# Altium schematic sheet Haberlesme.SchDoc
size A4; SheetNumber: 5; SheetTotal: 6
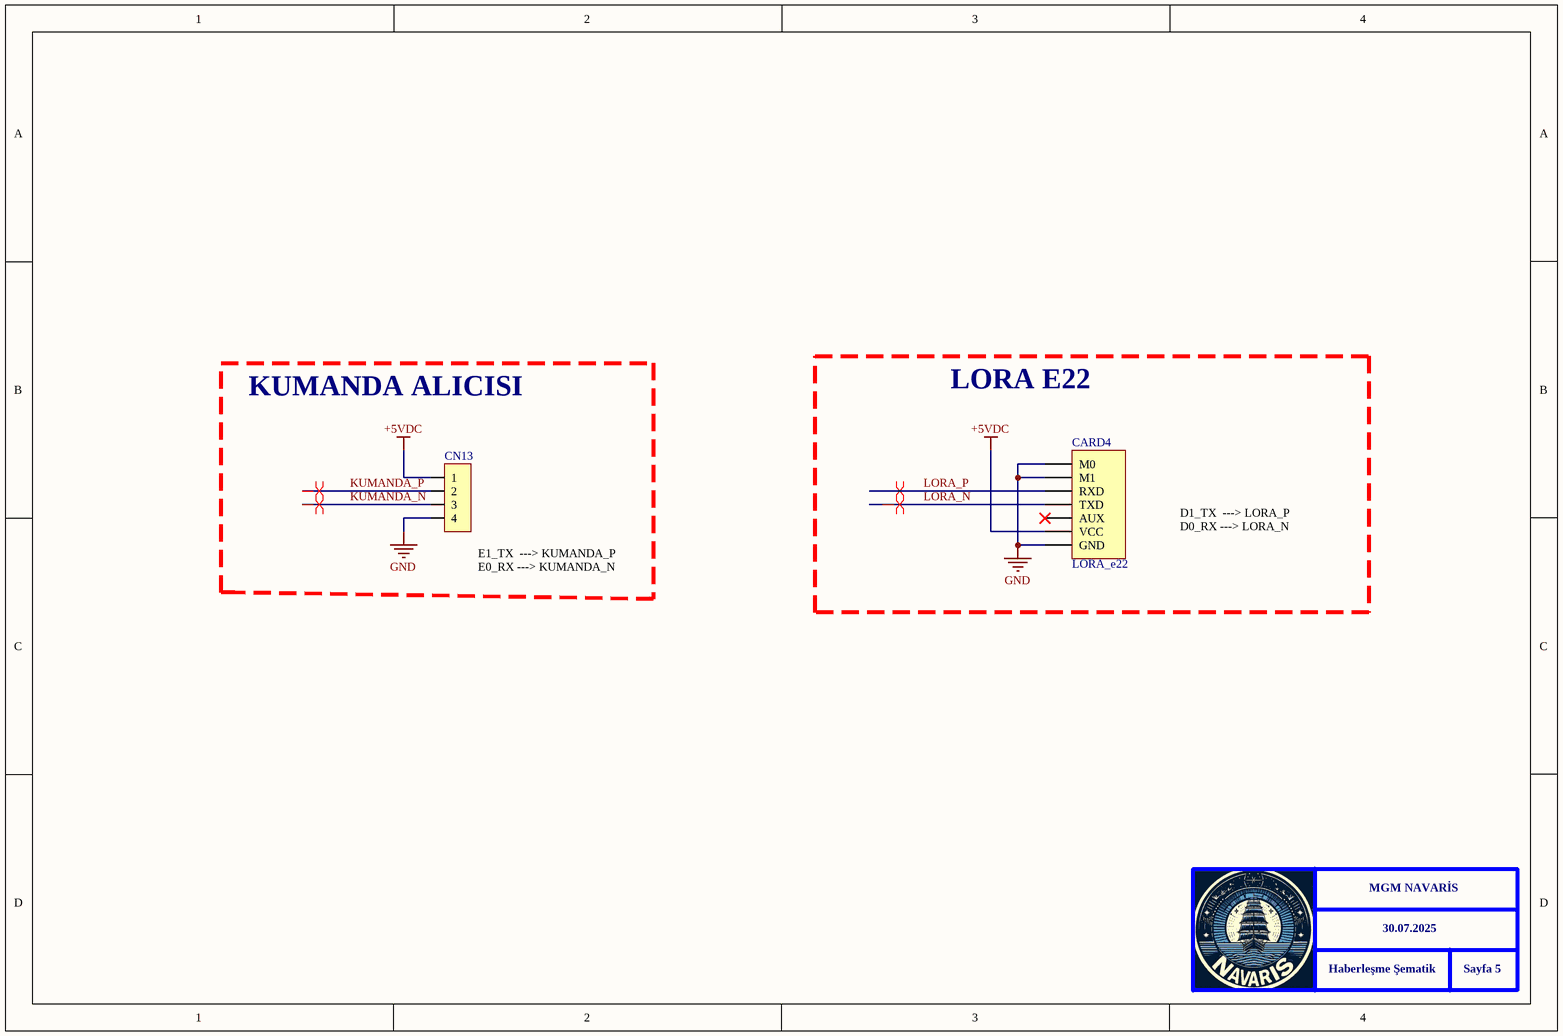
[diagram p0: Haberlesme.SchDoc]

## Parts
CARD4  LORA_e22  [LORA e22]
CN13  4_Pin_JST_Male  [4_Pin_JST_Male]  (value not drawn)

## Blocks framed on the sheet
LORA E22: CARD4

## Nets
+5VDC: CARD4.6(VCC) CN13.1
GND: CARD4.1(M0) CARD4.2(M1) CARD4.7(GND) CN13.4
KUMANDA_N: CN13.3
KUMANDA_P: CN13.2
LORA_N: CARD4.4(TXD)
LORA_P: CARD4.3(RXD)

Not connected (* = marked no-connect by the designer): CARD4 5(AUX)*

## Layout directives
differential pair; net class DIFF_LORA: LORA_N, LORA_P
differential pair; net class DIFF_KUMANDA: KUMANDA_N, KUMANDA_P

## Notes on the sheet
- KUMANDA ALICISI
- (near CN13) E1_TX  ---> KUMANDA_P
  E0_RX ---> KUMANDA_N
- D1_TX  ---> LORA_P
  D0_RX ---> LORA_N
- MGM NAVARİS
- Haberleşme Şematik
- 30.07.2025
- Sayfa 5